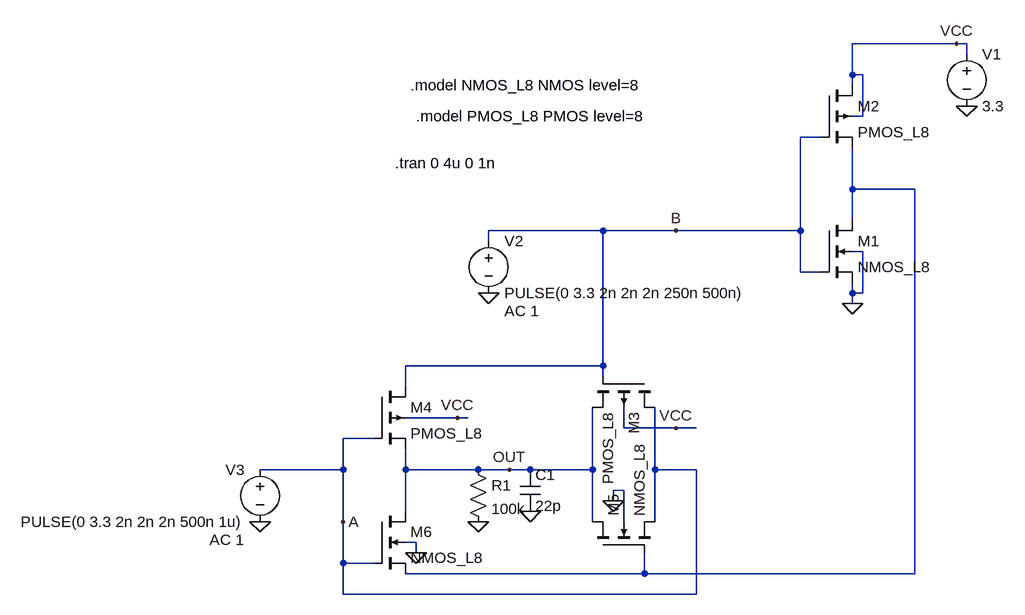
[diagram p0: schematic cmos_xor.asc]
cmos_xor.asc, the LTspice schematic file:
Version 4.1
SHEET 1 880 680
WIRE 592 -256 432 -256
WIRE 608 -256 592 -256
WIRE 608 -240 608 -256
WIRE 432 -208 432 -256
WIRE 448 -208 432 -208
WIRE 432 -192 432 -208
WIRE 448 -144 448 -208
WIRE 448 -144 432 -144
WIRE 384 -112 352 -112
WIRE 432 -32 432 -96
WIRE 528 -32 432 -32
WIRE 432 16 432 -32
WIRE 48 32 -128 32
WIRE 160 32 48 32
WIRE 352 32 352 -112
WIRE 352 32 160 32
WIRE -128 48 -128 32
WIRE 448 64 432 64
WIRE 352 96 352 32
WIRE 384 96 352 96
WIRE 432 128 432 112
WIRE 448 128 448 64
WIRE 448 128 432 128
WIRE 432 144 432 128
WIRE 48 240 48 32
WIRE 48 240 -256 240
WIRE 48 256 48 240
WIRE -256 272 -256 240
WIRE -176 320 -256 320
WIRE -160 320 -176 320
WIRE 80 336 80 304
WIRE 160 336 80 336
WIRE 192 336 160 336
WIRE -304 352 -352 352
WIRE -352 400 -352 352
WIRE -352 400 -480 400
WIRE -256 400 -256 368
WIRE -144 400 -256 400
WIRE -96 400 -144 400
WIRE -64 400 -96 400
WIRE 32 400 32 304
WIRE 32 400 -64 400
WIRE 128 400 128 304
WIRE 192 400 128 400
WIRE 80 432 64 432
WIRE 64 448 64 432
WIRE -256 464 -256 400
WIRE -352 480 -352 400
WIRE 32 480 32 400
WIRE 80 480 80 432
WIRE 128 480 128 400
WIRE -240 512 -256 512
WIRE -240 528 -240 512
WIRE -352 544 -352 480
WIRE -304 544 -352 544
WIRE 112 560 112 528
WIRE 112 560 -256 560
WIRE 528 560 528 -32
WIRE 528 560 112 560
WIRE -352 592 -352 544
WIRE 192 592 192 400
WIRE 192 592 -352 592
FLAG 432 144 0
FLAG 608 -160 0
FLAG 64 448 0
FLAG -240 528 0
FLAG 592 -256 VCC
FLAG 160 336 VCC
FLAG -176 320 VCC
FLAG -96 400 OUT
FLAG 160 32 B
FLAG -352 480 A
FLAG -128 128 0
FLAG -480 480 0
FLAG -144 480 0
FLAG -64 464 0
SYMBOL nmos4 384 16 R0
SYMATTR InstName M1
SYMATTR Value NMOS_L8
SYMATTR Value2 l=1u w=10u m=2
SYMBOL pmos4 384 -192 R0
SYMATTR InstName M2
SYMATTR Value PMOS_L8
SYMATTR Value2 l=1u w=10u m=2
SYMBOL voltage 608 -256 R0
WINDOW 123 0 0 Left 0
WINDOW 39 0 0 Left 0
SYMATTR InstName V1
SYMATTR Value 3.3
SYMBOL pmos4 128 256 R90
SYMATTR InstName M3
SYMATTR Value PMOS_L8
SYMATTR Value2 l=1u w=10u m=2
SYMBOL pmos4 -304 272 R0
SYMATTR InstName M4
SYMATTR Value PMOS_L8
SYMATTR Value2 l=1u w=10u m=2
SYMBOL nmos4 32 528 R270
SYMATTR InstName M5
SYMATTR Value NMOS_L8
SYMATTR Value2 l=1u w=10u m=2
SYMBOL nmos4 -304 464 R0
SYMATTR InstName M6
SYMATTR Value NMOS_L8
SYMATTR Value2 l=1u w=10u m=2
SYMBOL voltage -128 32 R0
WINDOW 123 24 124 Left 2
WINDOW 39 0 0 Left 0
SYMATTR InstName V2
SYMATTR Value PULSE(0 3.3 2n 2n 2n 250n 500n)
SYMATTR Value2 AC 1
SYMBOL voltage -480 384 M0
WINDOW 123 24 124 Left 2
WINDOW 39 0 0 Left 0
SYMATTR InstName V3
SYMATTR Value PULSE(0 3.3 2n 2n 2n 500n 1u)
SYMATTR Value2 AC 1
SYMBOL res -160 384 R0
SYMATTR InstName R1
SYMATTR Value 100k
SYMBOL cap -80 400 R0
SYMATTR InstName C1
SYMATTR Value 22p
TEXT -272 -72 Left 2 !.tran 0 4u 0 1n
TEXT -248 -192 Left 2 !.model NMOS_L8 NMOS level=8
TEXT -240 -144 Left 2 !.model PMOS_L8 PMOS level=8

The netlist it stands for:
* cmos_xor.asc
M1 N001 B 0 0 NMOS_L8 l=1u w=10u m=2
M2 VCC B N001 VCC PMOS_L8 l=1u w=10u m=2
V1 VCC 0 3.3
M3 A B OUT VCC PMOS_L8 l=1u w=10u m=2
M4 B A OUT VCC PMOS_L8 l=1u w=10u m=2
M5 OUT N001 A 0 NMOS_L8 l=1u w=10u m=2
M6 OUT A N001 0 NMOS_L8 l=1u w=10u m=2
V2 B 0 PULSE(0 3.3 2n 2n 2n 250n 500n) AC 1
V3 A 0 PULSE(0 3.3 2n 2n 2n 500n 1u) AC 1
R1 OUT 0 100k
C1 OUT 0 22p
.model NMOS NMOS
.model PMOS PMOS
.lib standard.mos
.tran 0 4u 0 1n
.model NMOS_L8 NMOS level=8
.model PMOS_L8 PMOS level=8
.backanno
.end